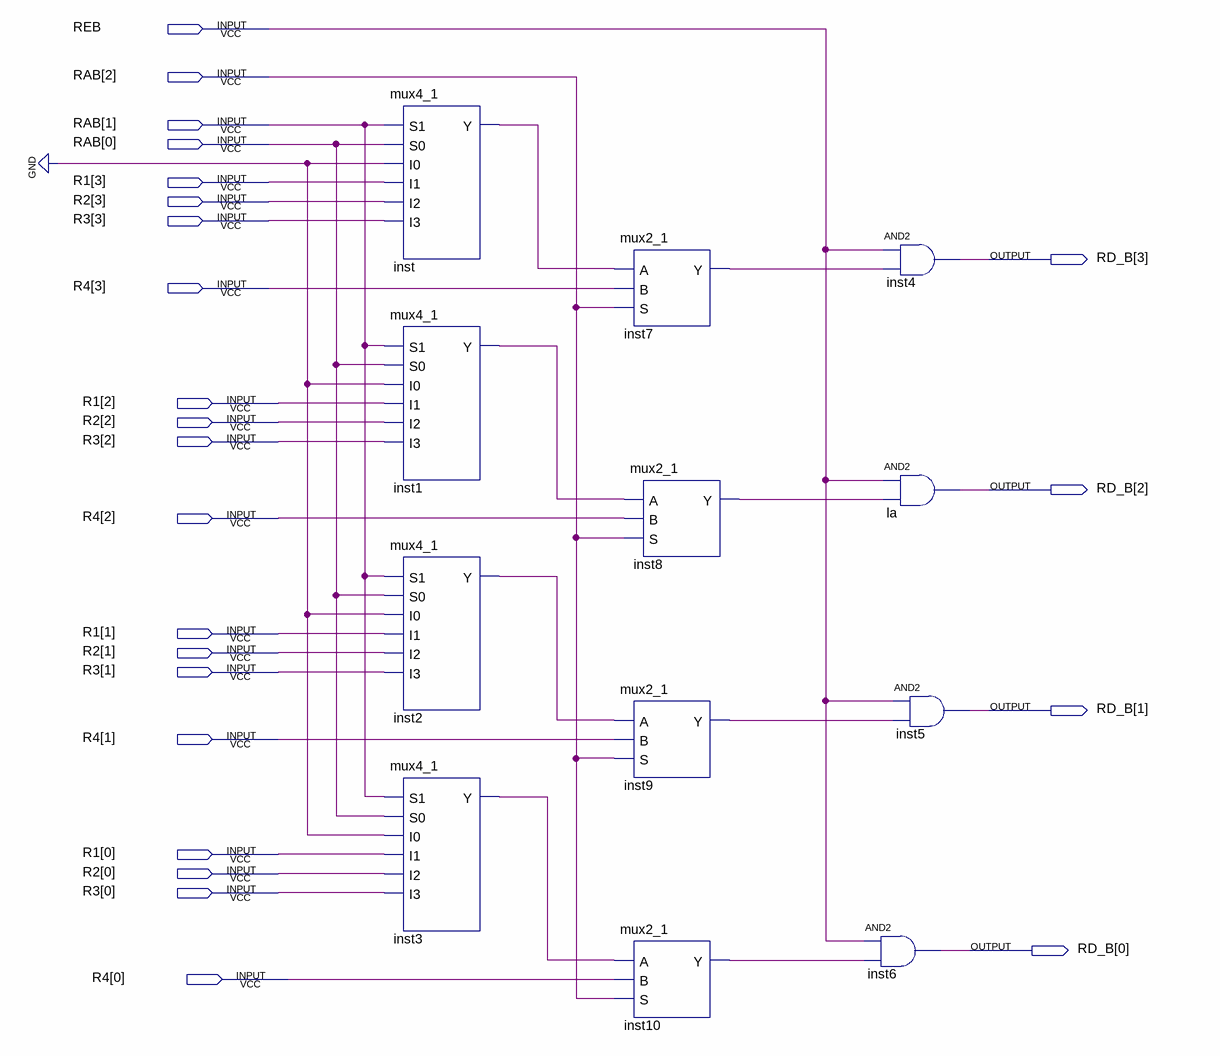
[diagram p0: schematic sheet]
// Quartus schematic Read_B.bdf as structural Verilog: 12 symbols, 24 pins
module Read_B (
  input  REB,
  input  [2:0] RAB,
  input  [3:0] R1,
  input  [3:0] R2,
  input  [3:0] R3,
  input  [3:0] R4,
  output [3:0] RD_B
);

  wire inst1_y, inst2_y, inst3_y, inst7_y, inst8_y, inst9_y, inst10_y, inst_y;

  mux4_1 inst (.S1(RAB[1]), .S0(RAB[0]), .I0(1'b0), .I1(R1[3]), .I2(R2[3]), .I3(R3[3]), .Y(inst_y));
  mux4_1 inst1 (.S1(RAB[1]), .S0(RAB[0]), .I0(1'b0), .I1(R1[2]), .I2(R2[2]), .I3(R3[2]), .Y(inst1_y));
  mux4_1 inst2 (.S1(RAB[1]), .S0(RAB[0]), .I0(1'b0), .I1(R1[1]), .I2(R2[1]), .I3(R3[1]), .Y(inst2_y));
  mux4_1 inst3 (.S1(RAB[1]), .S0(RAB[0]), .I0(1'b0), .I1(R1[0]), .I2(R2[0]), .I3(R3[0]), .Y(inst3_y));
  mux2_1 inst7 (.A(inst_y), .B(R4[3]), .S(RAB[2]), .Y(inst7_y));
  mux2_1 inst8 (.A(inst1_y), .B(R4[2]), .S(RAB[2]), .Y(inst8_y));
  mux2_1 inst9 (.A(inst2_y), .B(R4[1]), .S(RAB[2]), .Y(inst9_y));
  mux2_1 inst10 (.A(inst3_y), .B(R4[0]), .S(RAB[2]), .Y(inst10_y));
  and inst4 (RD_B[3], REB, inst7_y);
  and la (RD_B[2], REB, inst8_y);
  and inst5 (RD_B[1], REB, inst9_y);
  and inst6 (RD_B[0], REB, inst10_y);
endmodule
